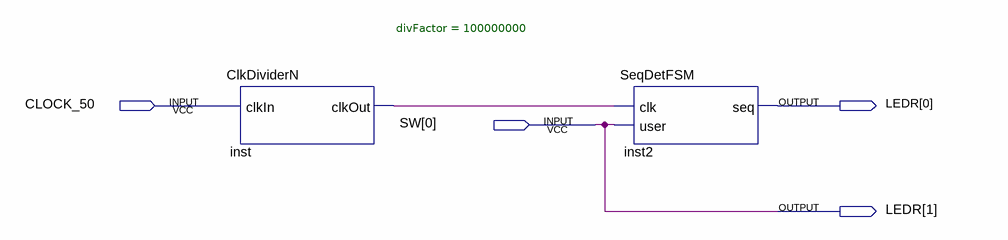
[diagram p0: schematic sheet]
// Quartus schematic SeqDetector.bdf as structural Verilog: 2 symbols, 4 pins
module SeqDetector (
  input  CLOCK_50,
  input  [0:0] SW,
  output [1:0] LEDR
);

  wire inst_clkout;

  ClkDividerN #(.divFactor(100000000)) inst (.clkIn(CLOCK_50), .clkOut(inst_clkout));
  SeqDetFSM inst2 (.clk(inst_clkout), .user(SW[0]), .seq(LEDR[0]));

  assign LEDR[1] = SW[0];
endmodule
